# Altium schematic sheet FPGA_board_conn_pt1.SchDoc: JM1 TE0720 carrier connector
size A4; DocumentNumber: ADC-SCH-14; SheetNumber: 14; SheetTotal: 20
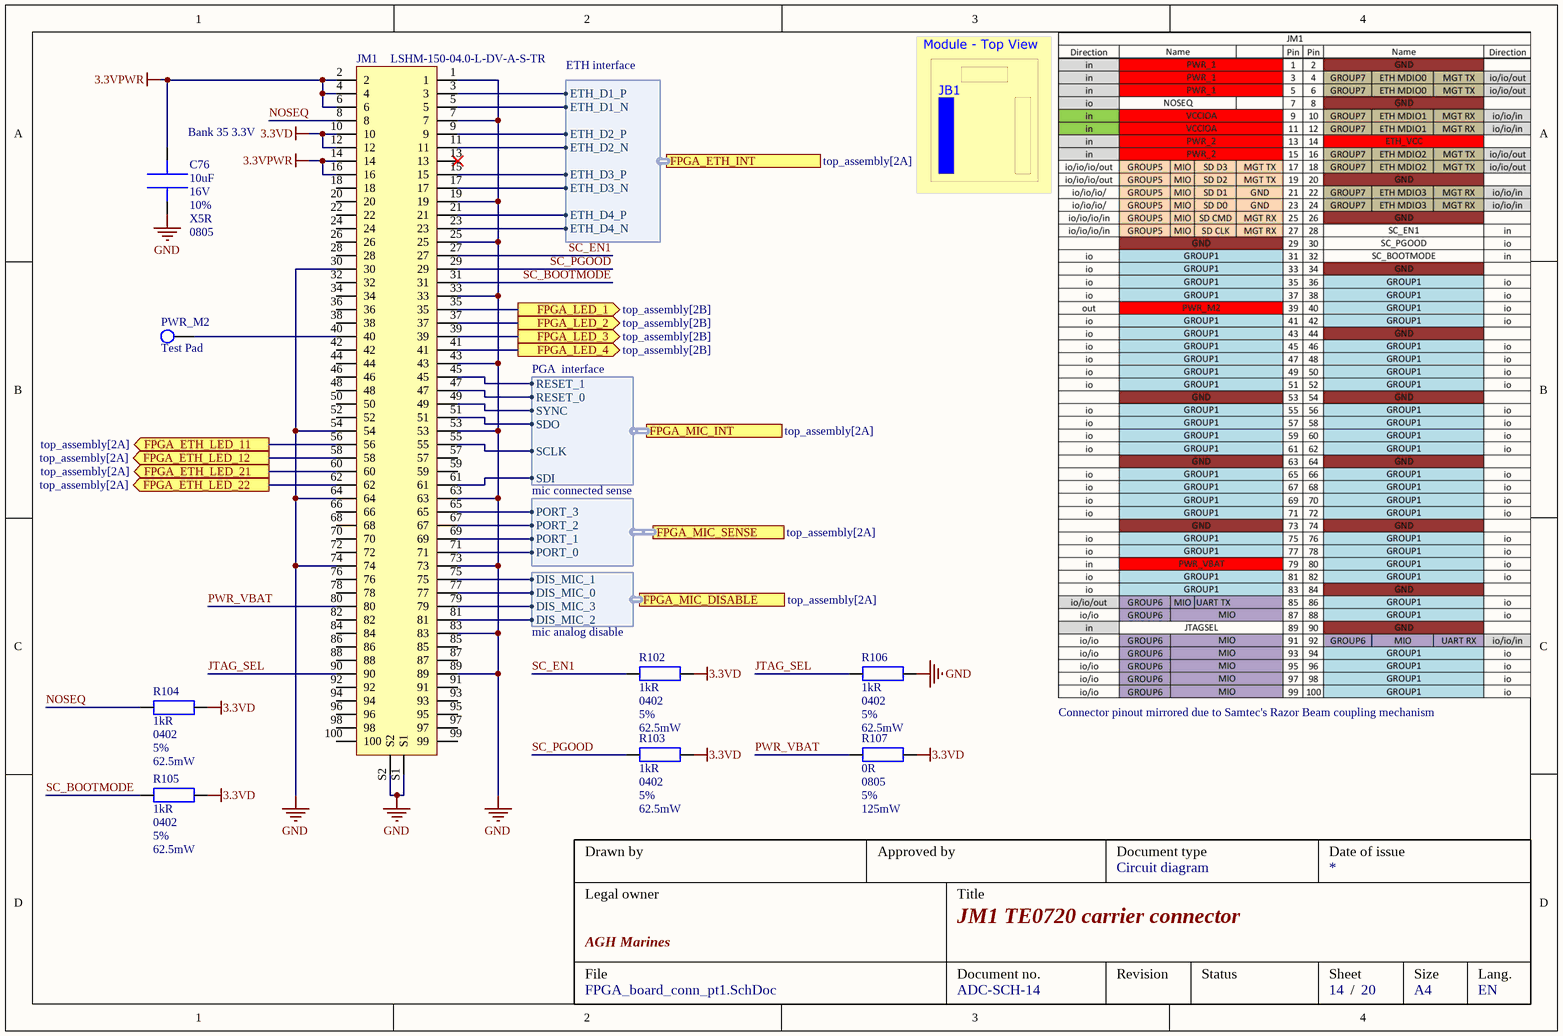
[diagram p0: FPGA_board_conn_pt1.SchDoc]

## Parts
C76  value 10uF  Voltage: 16V  Tolerance: 10%  Dielectric: X5R  Package: 0805  [CAPC_0805]  (hidden comment: EMK212BJ106KG-T)
JM1  LSHM-150-04.0-L-DV-A-S-TR  [CONS_LSHM-150-04.0-L-DV-A-S-TR]
PWR_M2  Test Pad  [TP_1mm]
R102  value 1kR  Package: 0402  Tolerance: 5%  Power: 62.5mW  [RESC_0402]  (hidden comment: RC0402JR-7D1KL)
R103  value 1kR  Package: 0402  Tolerance: 5%  Power: 62.5mW  [RESC_0402]  (hidden comment: RC0402JR-7D1KL)
R104  value 1kR  Package: 0402  Tolerance: 5%  Power: 62.5mW  [RESC_0402]  (hidden comment: RC0402JR-7D1KL)
R105  value 1kR  Package: 0402  Tolerance: 5%  Power: 62.5mW  [RESC_0402]  (hidden comment: RC0402JR-7D1KL)
R106  value 1kR  Package: 0402  Tolerance: 5%  Power: 62.5mW  [RESC_0402]  (hidden comment: RC0402JR-7D1KL)
R107  value 0R  Package: 0805  Tolerance: 5%  Power: 125mW  [RESC_0805]  (hidden comment: RC0805JR-070RP)

## Ports
FPGA_ETH_INT (harness ETH interface, see top_assembly[2A]), FPGA_ETH_LED_11 (out, see top_assembly[2A]), FPGA_ETH_LED_12 (out, see top_assembly[2A]), FPGA_ETH_LED_21 (out, see top_assembly[2A]), FPGA_ETH_LED_22 (out, see top_assembly[2A]), FPGA_LED_1 (out, see top_assembly[2B]), FPGA_LED_2 (out, see top_assembly[2B]), FPGA_LED_3 (out, see top_assembly[2B]), FPGA_LED_4 (out, see top_assembly[2B]), FPGA_MIC_DISABLE (harness mic analog disable, see top_assembly[2A]), FPGA_MIC_INT (harness PGA  interface, see top_assembly[2A]), FPGA_MIC_SENSE (harness mic connected sense, see top_assembly[2A])

## Harnesses
ETH interface: ETH_D1_P, ETH_D1_N, ETH_D2_P, ETH_D2_N, ETH_D3_P, ETH_D3_N, ETH_D4_P, ETH_D4_N
mic connected sense: PORT_2, PORT_0, PORT_3, PORT_1
mic analog disable: DIS_MIC_1, DIS_MIC_0, DIS_MIC_3, DIS_MIC_2
PGA  interface: RESET_1, RESET_0, SYNC, SCLK, SDI, SDO

## Nets
3.3VD: JM1.10 JM1.12 R102.1 R103.1 R104.1 R105.1 R107.1
3.3VPWR: C76.2 JM1.2 JM1.4 JM1.6 JM1.14 JM1.16
GND: C76.1 JM1.1 JM1.7 JM1.19 JM1.25 JM1.30 JM1.33 JM1.43 JM1.53 JM1.54 JM1.63 JM1.64 JM1.73 JM1.74 JM1.83 JM1.89 JM1.S1 JM1.S2 R106.1
FPGA_ETH_LED_11: JM1.56 ; port FPGA_ETH_LED_11
FPGA_ETH_LED_12: JM1.58 ; port FPGA_ETH_LED_12
FPGA_ETH_LED_21: JM1.60 ; port FPGA_ETH_LED_21
FPGA_ETH_LED_22: JM1.62 ; port FPGA_ETH_LED_22
FPGA_LED_1: JM1.35 ; port FPGA_LED_1
FPGA_LED_2: JM1.37 ; port FPGA_LED_2
FPGA_LED_3: JM1.39 ; port FPGA_LED_3
FPGA_LED_4: JM1.41 ; port FPGA_LED_4
JTAG_SEL: JM1.90 R106.2
NOSEQ: JM1.8 R104.2
PWR_VBAT: JM1.80 R107.2
SC_BOOTMODE: JM1.31 R105.2
SC_EN1: JM1.27 R102.2
SC_PGOOD: JM1.29 R103.2
NetJM1_3: JM1.3 ; port FPGA_ETH_INT.ETH_D1_P
NetJM1_5: JM1.5 ; port FPGA_ETH_INT.ETH_D1_N
NetJM1_9: JM1.9 ; port FPGA_ETH_INT.ETH_D2_P
NetJM1_11: JM1.11 ; port FPGA_ETH_INT.ETH_D2_N
NetJM1_15: JM1.15 ; port FPGA_ETH_INT.ETH_D3_P
NetJM1_17: JM1.17 ; port FPGA_ETH_INT.ETH_D3_N
NetJM1_21: JM1.21 ; port FPGA_ETH_INT.ETH_D4_P
NetJM1_23: JM1.23 ; port FPGA_ETH_INT.ETH_D4_N
NetJM1_40: JM1.40 PWR_M2.1
NetJM1_45: JM1.45 ; port FPGA_MIC_INT.RESET_1
NetJM1_47: JM1.47 ; port FPGA_MIC_INT.RESET_0
NetJM1_49: JM1.49 ; port FPGA_MIC_INT.SYNC
NetJM1_51: JM1.51 ; port FPGA_MIC_INT.SDO
NetJM1_55: JM1.55 ; port FPGA_MIC_INT.SCLK
NetJM1_61: JM1.61 ; port FPGA_MIC_INT.SDI
NetJM1_65: JM1.65 ; port FPGA_MIC_SENSE.PORT_3
NetJM1_67: JM1.67 ; port FPGA_MIC_SENSE.PORT_2
NetJM1_69: JM1.69 ; port FPGA_MIC_SENSE.PORT_1
NetJM1_71: JM1.71 ; port FPGA_MIC_SENSE.PORT_0
NetJM1_75: JM1.75 ; port FPGA_MIC_DISABLE.DIS_MIC_1
NetJM1_77: JM1.77 ; port FPGA_MIC_DISABLE.DIS_MIC_0
NetJM1_79: JM1.79 ; port FPGA_MIC_DISABLE.DIS_MIC_3
NetJM1_81: JM1.81 ; port FPGA_MIC_DISABLE.DIS_MIC_2

Not connected (* = marked no-connect by the designer): JM1 13* 18 20 22 24 26 28 32 34 36 38 42 44 46 48 50 52 57 59 66 68 70 72 76 78 82 84 85 86 87 88 91 92 93 94 95 96 97 98 99 100

## Notes on the sheet
- (near C76) Bank 35 3.3V
- Connector pinout mirrored due to Samtec's Razor Beam coupling mechanism
- Drawn by
- Approved by
- Document type
- Date of issue
- Legal owner
- Title
- Circuit diagram
- File
- AGH Marines
- Document no.
- Revision
- Status
- Sheet
- Size
- Lang.
- /
- A4
- EN

## Library data of the parts
C76 = EMK212BJ106KG-T: Multilayer Ceramic Capacitors MLCC - SMD/SMT 16V 10uF X5R 0805 10 %; Manufacturer: TAIYO YUDEN; Supplier 1: Mouser; Supplier Part Number 1: 963-EMK212BJ106KG-T
JM1 = LSHM-150-04.0-L-DV-A-S-TR: Board to Board & Mezzanine Connectors 0.50 mm Razor Beam(TM) High-Speed Hermaphroditic Terminal/Socket Strip; Manufacturer: Samtec; Supplier 1: Mouser; Supplier Part Number 1: 200-LSHM15004.0LDVAS; ClassName: FPGA_Socket
R102-R106 = RC0402JR-7D1KL: Thick Film Resistors - SMD General Purpose Chip Resistor 0402, 1kOhms, 5%, 1/16W; Manufacturer: YAGEO; Supplier 1: Mouser; Supplier Part Number 1: 603-RC0402JR-7D1KL
R107 = RC0805JR-070RP: Thick Film Resistors - SMD General Purpose Chip Resistor 0805, 0Ohms, 5%, 1/8W; Manufacturer: YAGEO; Supplier 1: Mouser; Supplier Part Number 1: 603-RC0805JR-070RP